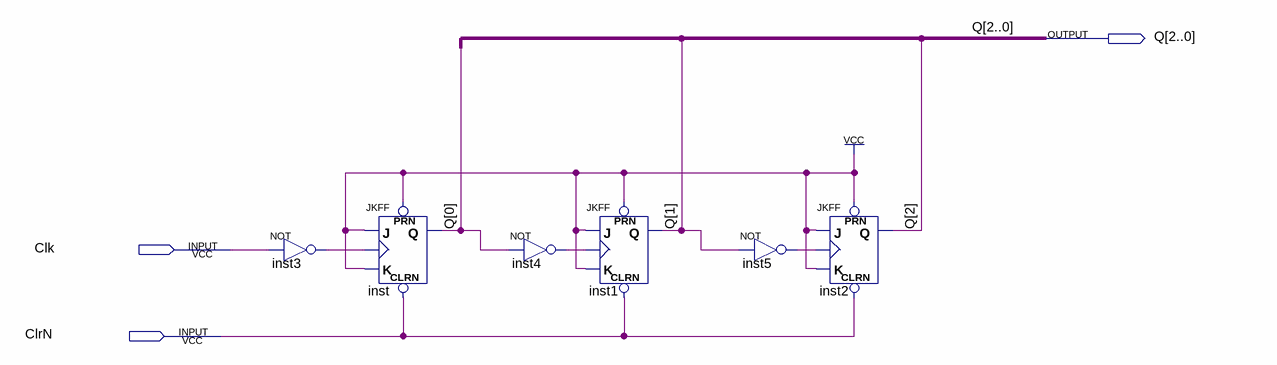
[diagram p0: schematic sheet]
// Quartus schematic Ripple_up.bdf as structural Verilog: 6 symbols, 3 pins
module Ripple_up (
  input  Clk,
  input  ClrN,
  output [2:0] Q
);

  wire inst3_out, inst4_out, inst5_out;

  not inst3 (inst3_out, Clk);
  JKFF inst (.PRN(1'b1), .CLRN(ClrN), .K(1'b1), .J(1'b1), .CLK(inst3_out), .Q(Q[0]));
  not inst4 (inst4_out, Q[0]);
  JKFF inst1 (.PRN(1'b1), .CLRN(ClrN), .K(1'b1), .J(1'b1), .CLK(inst4_out), .Q(Q[1]));
  not inst5 (inst5_out, Q[1]);
  JKFF inst2 (.PRN(1'b1), .CLRN(ClrN), .K(1'b1), .J(1'b1), .CLK(inst5_out), .Q(Q[2]));
endmodule
